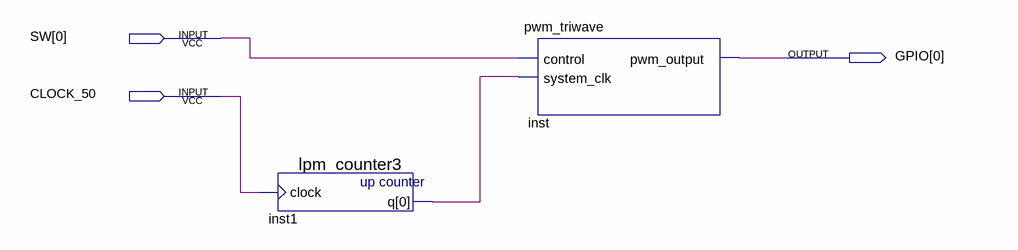
[diagram p0: schematic sheet]
// Quartus schematic pwm_audio.bdf as structural Verilog: 2 symbols, 3 pins
module pwm_audio (
  input  [0:0] SW,
  input  CLOCK_50,
  output [0:0] GPIO
);

  wire inst1_q;

  lpm_counter3 inst1 (.clock(CLOCK_50), .q(inst1_q));
  pwm_triwave inst (.control(SW[0]), .system_clk(inst1_q), .pwm_output(GPIO[0]));
endmodule
